# Altium schematic sheet MCU.SchDoc
size A3; SheetNumber: 3; SheetTotal: 5
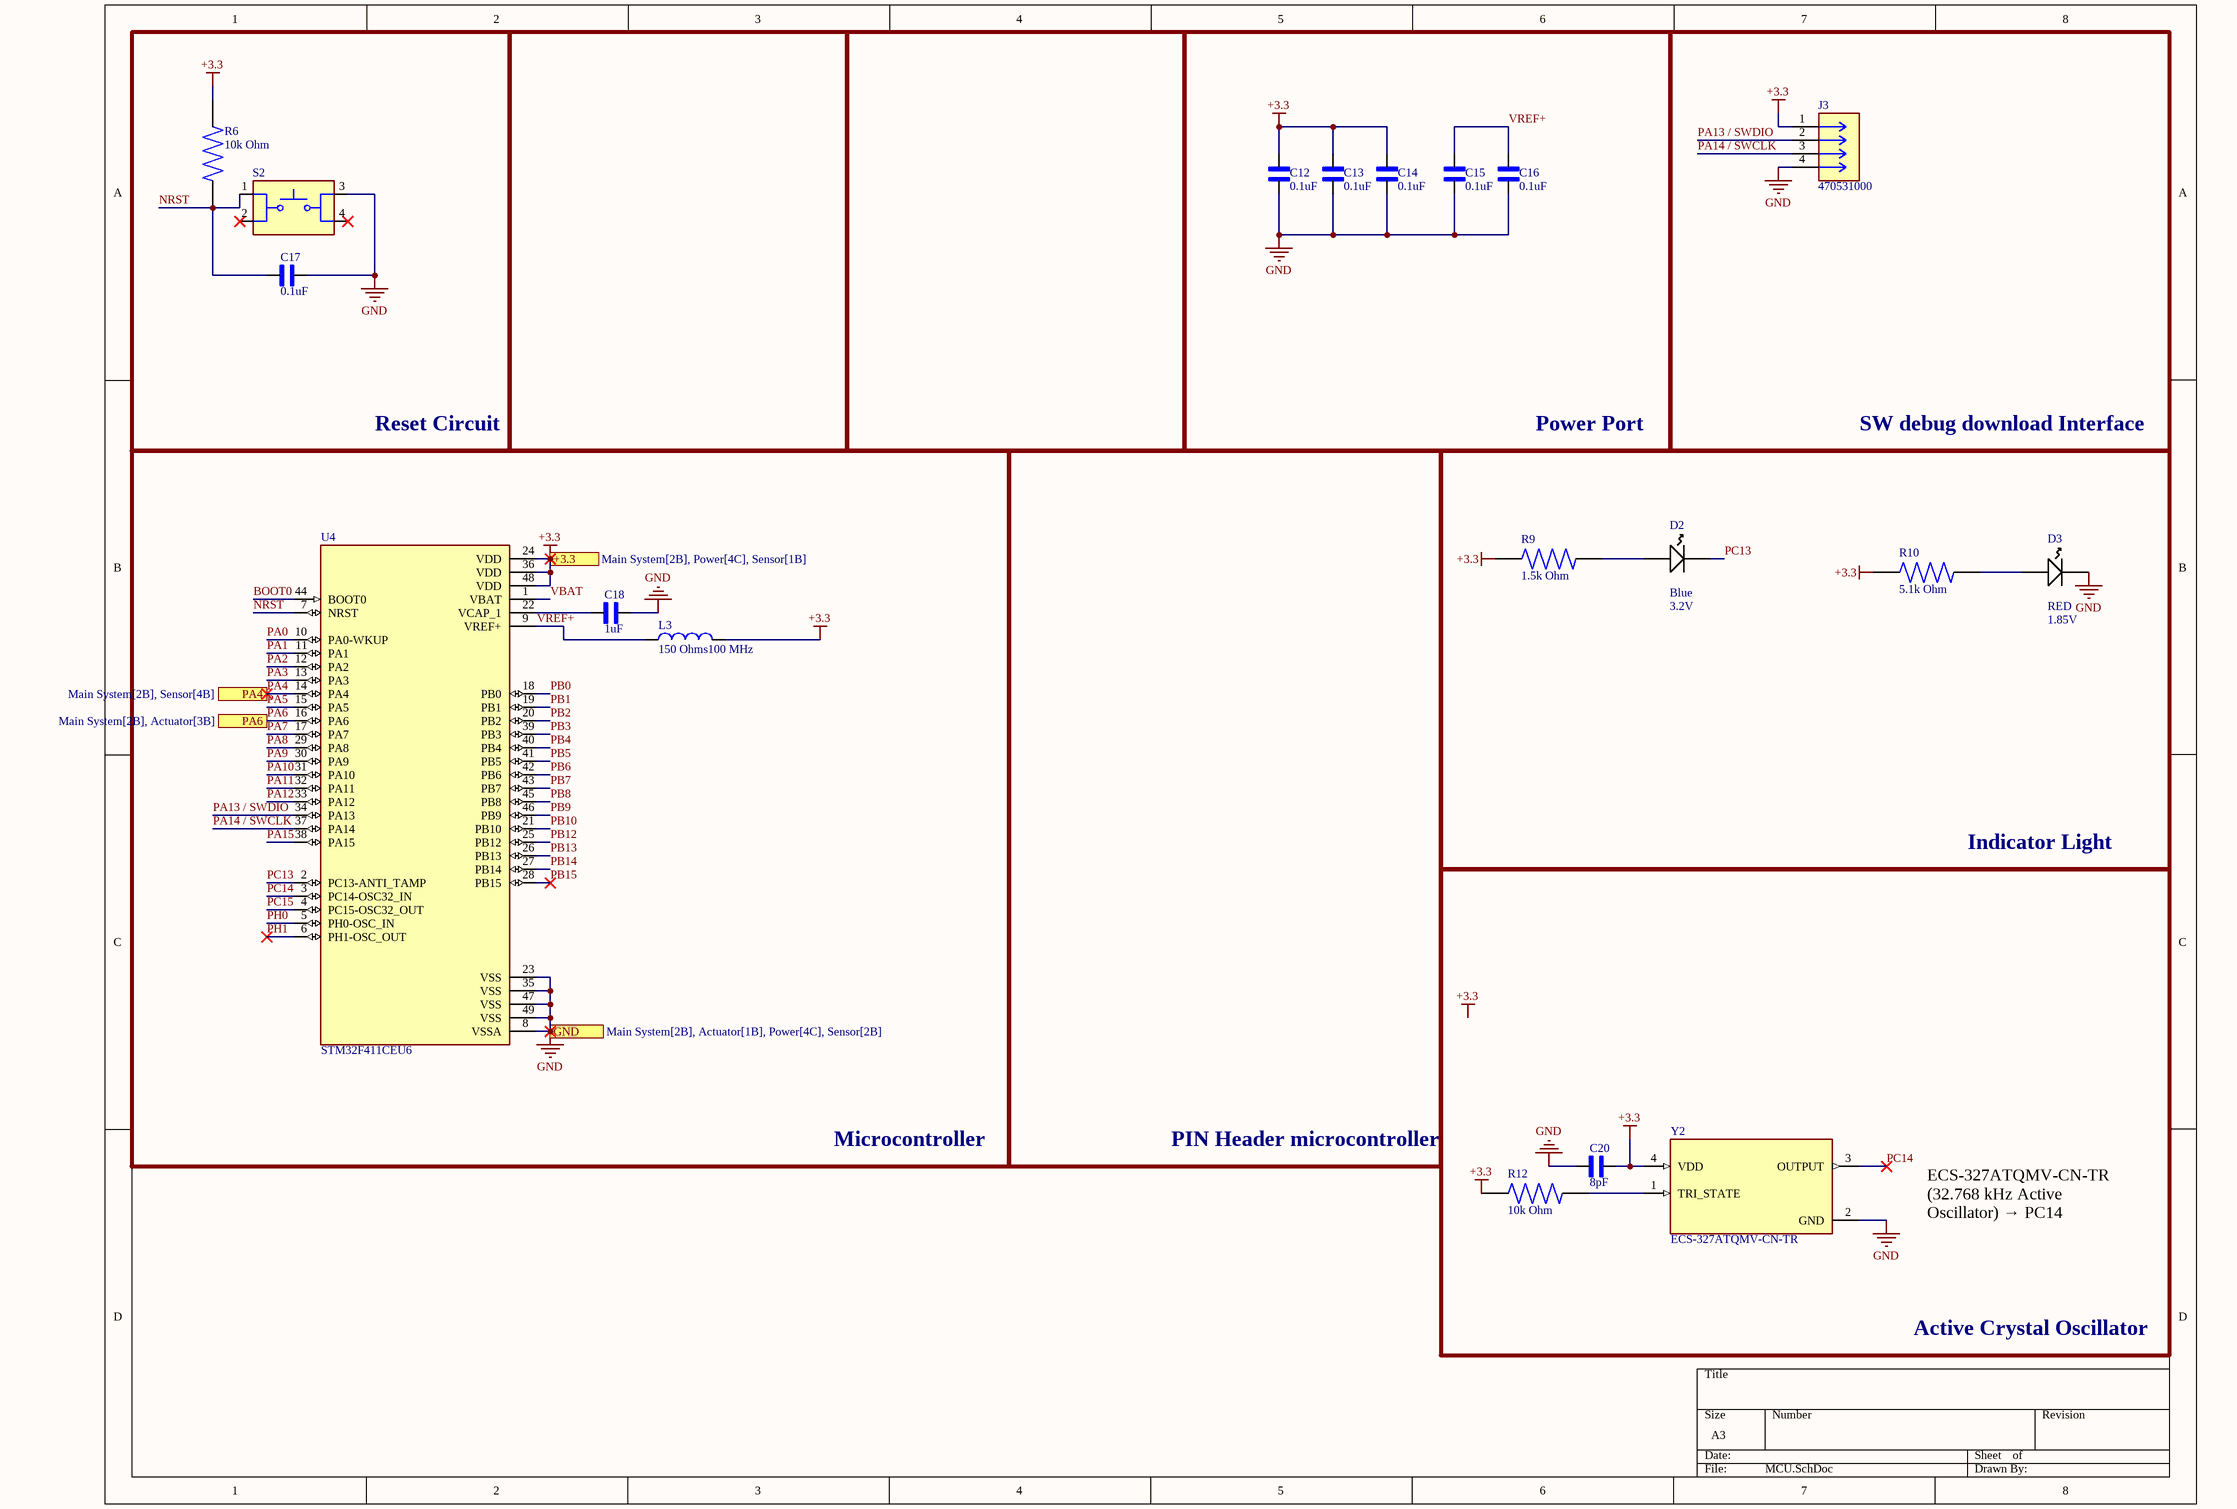
[diagram p0: MCU.SchDoc]

## Parts
C12  0.1uF  [CAPC1005X55N]
C13  0.1uF  [CAPC1005X55N]
C14  0.1uF  [CAPC1005X55N]
C15  0.1uF  [CAPC1005X55N]
C16  0.1uF  [CAPC1005X55N]
C17  0.1uF  [CAPC1005X55N]
C18  1uF  [CAPC1005X55N]
C20  8pF  [CAPC1005X55N]
D2  Color: Blue  Forward Voltage: 3.2V  [LED1913X12NBLUE]  (hidden comment: Kingbright Blue LED, 60 mcd 120 ° 0805)
D3  Color: RED  Forward Voltage: 1.85V  [LED1913X12NRED]  (hidden comment: Kingbright Red LED, 100 mcd 120 ° 0805)
J3  470531000  [CONN_SD-47053-001_H10P00_MOL]
L3  150 Ohms100 MHz  [WE-CBF_0603_W2.2]
R6  10k Ohm  [RESC1005X40N]
R9  1.5k Ohm  [RESC1005X40N]
R10  5.1k Ohm  [RESC1005X40N]
R12  10k Ohm  [RESC1005X40N]
S2  SWT0310-043025GSA_REVA  [SW_SWT0310-043025GSA_REVA]  (value not drawn)
U4  STM32F411CEU6  [QFN50P700X700X60-49N]
Y2  ECS-327ATQMV-CN-TR  [OSC_ECS-2520S25-250-FN-TR]

## Blocks framed on the sheet
Reset Circuit: C17 R6 S2
Power Port: C12-C16
SW debug download Interface: J3
Microcontroller: C18 L3 U4
Indicator Light: D2 D3 R9 R10
Active Crystal Oscillator: C20 R12 Y2

## Ports
+3.3 (see Main System[2B], Power[4C], Sensor[1B]), GND (see Main System[2B], Actuator[1B], Power[4C], Sensor[2B]), PA4 (see Main System[2B], Sensor[4B]), PA6 (see Main System[2B], Actuator[3B])

## Nets
+3.3: C12.2 C13.2 C14.2 C20.2 J3.1 L3.2 R6.2 R9.2 R10.2 R12.2 U4.24(VDD) U4.36(VDD) U4.48(VDD) Y2.4(VDD) ; port +3.3
GND: C12.1 C13.1 C14.1 C15.1 C16.1 C17.2 C18.2 C20.1 D3.2(K) J3.4 S2.3 U4.8(VSSA) U4.23(VSS) U4.35(VSS) U4.47(VSS) U4.49(VSS) Y2.2(GND) ; port GND
BOOT0: U4.44(BOOT0)
NRST: C17.1 R6.1 S2.1 U4.7(NRST)
PA0: U4.10(PA0-WKUP)
PA1: U4.11(PA1)
PA2: U4.12(PA2)
PA3: U4.13(PA3)
PA4: U4.14(PA4) ; port PA4
PA5: U4.15(PA5)
PA6: U4.16(PA6) ; port PA6
PA7: U4.17(PA7)
PA8: U4.29(PA8)
PA9: U4.30(PA9)
PA10: U4.31(PA10)
PA11: U4.32(PA11)
PA12: U4.33(PA12)
PA13 / SWDIO: J3.2 U4.34(PA13)
PA14 / SWCLK: J3.3 U4.37(PA14)
PA15: U4.38(PA15)
PB0: U4.18(PB0)
PB1: U4.19(PB1)
PB2: U4.20(PB2)
PB3: U4.39(PB3)
PB4: U4.40(PB4)
PB5: U4.41(PB5)
PB6: U4.42(PB6)
PB7: U4.43(PB7)
PB8: U4.45(PB8)
PB9: U4.46(PB9)
PB10: U4.21(PB10)
PB12: U4.25(PB12)
PB13: U4.26(PB13)
PB14: U4.27(PB14)
PB15: U4.28(PB15)
PC13: D2.2(K) U4.2(PC13-ANTI_TAMP)
PC14: U4.3(PC14-OSC32_IN) Y2.3(OUTPUT)
PC15: U4.4(PC15-OSC32_OUT)
PH0: U4.5(PH0-OSC_IN)
PH1: U4.6(PH1-OSC_OUT)
VBAT: U4.1(VBAT)
VREF+: C15.2 C16.2 L3.1 U4.9(VREF+)
NetC18_1: C18.1 U4.22(VCAP_1)
NetD2_1: D2.1(A) R9.1
NetD3_1: D3.1(A) R10.1
NetR12_1: R12.1 Y2.1(TRI_STATE)

Not connected (* = marked no-connect by the designer): S2 2* 4*

## Notes on the sheet
- PIN Header microcontroller
- ECS-327ATQMV-CN-TR (32.768 kHz Active Oscillator) → PC14 (OSC32_IN)
- Labels drawn without touching a wire or pin: +3.3

## Library data of the parts
C12-C18 C20 = GRM155R71A104KA01D: GRM155R71A104KA01D Cap C eramic 0.1uF 10VDC X7R 10 % SMD 0402 Paper T/R RoHS; MF: Murata; SnapEDA_Link: https://www.snapeda.com/parts/GRM155R71A104KA01D/Murata/view-part/?ref=snap; Package: 1005-2 Murata; Value: *; MP: GRM155R71A104KA01D; Check_prices: https://www.snapeda.com/parts/GRM155R71A104KA01D/Murata/view-part/?ref=eda
D2 = Kingbright Blue LED, 60 mcd 120 ° 0805: Manufacturer Part No.: KP-2012PBC-A; Creator: Ritesh Kanjee; Date Created: 18 February 2015; Manufacturer: KingBright; RS Stock No.: 466-3784; Datasheet URL: http://za.rs-online.com/web/p/visible-leds/4663784/
D3 = Kingbright Red LED, 100 mcd 120 ° 0805: Manufacturer Part No.: KP-2012SRC-PRV; Creator: Ritesh Kanjee; Date Created: 18 February 2015; Manufacturer: KingBright; RS Stock No.: 466-3813; Datasheet URL: http://za.rs-online.com/web/p/visible-leds/4663813/
J3 = 470531000: Conn Wire to Board HDR 4 POS 2.54mm Solder ST Thru-Hole KKÂ® Bag; MF: Molex; SnapEDA_Link: https://www.snapeda.com/parts/470531000/Molex/view-part/?ref=snap; Package: None; Value: *; MP: 470531000; Check_prices: https://www.snapeda.com/parts/470531000/Molex/view-part/?ref=eda
L3 = WE-CBF_0603: 150 Ohms @ 100 MHz 1 Power, Signal Line Ferrite Bead 0402 (1005 Metric) 100mA 300mOhm; MF: WÃ¼rth Elektronik; MP: 742792693; SnapEDA_Link: https://www.snapeda.com/parts/742792693/W%25C3%25BCrth+Elektronik+Midcom/view-part/?ref=snap; Package: 0603 Wurth Elektronik; Value: *; Check_prices: https://www.snapeda.com/parts/742792693/W%25C3%25BCrth+Elektronik+Midcom/view-part/?ref=eda
R6 R9 R10 R12 = CRCW040210K0FKED: Resistor;Thick Film;10 Kilohms;0.063 W;1%;SMT;0402;TCR 37 ppm/DegC;Tape and Reel | Vishay Dale CRCW040210K0FKED; SnapEDA_Link: https://www.snapeda.com/parts/CRCW040210K0FKED/Dale/view-part/?ref=snap; Package: Package; Value: *; MF: Vishay Dale; MP: CRCW040210K0FKED; Check_prices: https://www.snapeda.com/parts/CRCW040210K0FKED/Dale/view-part/?ref=eda
S2 = SWT0310-043025GSA_REVA: 6mm x 6mm Gull Wing Tactile Switch; MF: Global Connector Technology; SnapEDA_Link: https://www.snapeda.com/parts/SWT0310-043025GSA/Global+Connector+Technology/view-part/?ref=snap; Package: None; Value: *; MP: SWT0310-043025GSA; Check_prices: https://www.snapeda.com/parts/SWT0310-043025GSA/Global+Connector+Technology/view-part/?ref=eda
U4 = STM32F411CEU6: High-performance access line, ARM Cortex-M4 core with DSP and FPU, 512 Kbytes Flash, 100 MHz CPU, ART Accelerator; Package: None; Availability: Unavailable; Value: *; MP: STM32F411CEU6; Price: None
Y2 = ECS-2520MV-250-CN-TR: 32.768 kHz XO (Standard) CMOS Oscillator 1.62V ~ 3.63V Enable/Disable 4-SMD, No Lead; MF: ECS Inc.; SnapEDA_Link: https://www.snapeda.com/parts/ECS-2520MV-250-CN-TR/ECS/view-part/?ref=snap; Package: ECS-2520MV-0-4 ECS; Value: *; MP: ECS-2520MV-250-CN-TR; Check_prices: https://www.snapeda.com/parts/ECS-2520MV-250-CN-TR/ECS/view-part/?ref=eda